# Altium schematic sheet Connector_Sheet.SchDoc
size A4; SheetNumber: 4; SheetTotal: 5
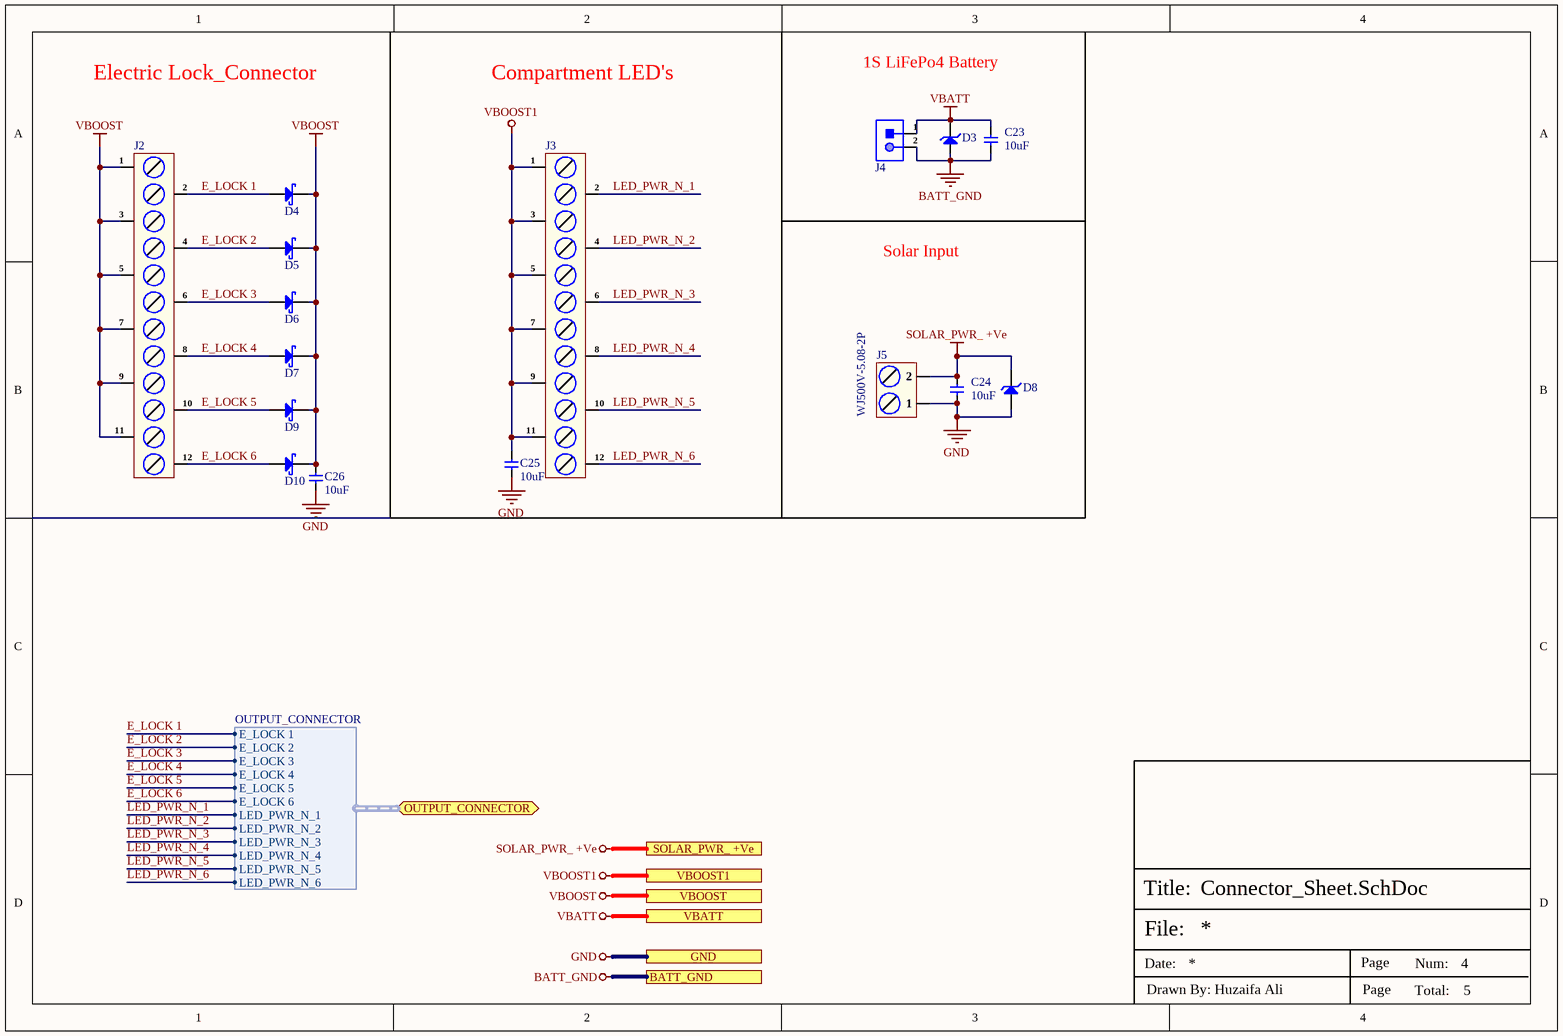
[diagram p0: Connector_Sheet.SchDoc]

## Parts
C23  10uF  [Cap-0603]
C24  10uF  [Cap-0603]
C25  10uF  [Cap-0603]
C26  10uF  [Cap-0603]
D3  SMBJ5.0A  [SMB_]  (value not drawn)
D4  1N5819HW-7-F  [SOD-123]  (value not drawn)
D5  1N5819HW-7-F  [SOD-123]  (value not drawn)
D6  1N5819HW-7-F  [SOD-123]  (value not drawn)
D7  1N5819HW-7-F  [SOD-123]  (value not drawn)
D8  AZ4024-01G  [SOD-123]  (value not drawn)
D9  1N5819HW-7-F  [SOD-123]  (value not drawn)
D10  1N5819HW-7-F  [SOD-123]  (value not drawn)
J2  MX128-5.0-12P-GN01-Cu-Y-A  [MX128-5.0-12P-GN01-Cu-Y-A]  (value not drawn)
J3  MX128-5.0-12P-GN01-Cu-Y-A  [MX128-5.0-12P-GN01-Cu-Y-A]  (value not drawn)
J4  S2B-PH-SM4-TB(LF)(SN)  [S2B-PH-SM4-TB(LF)(SN)]  (value not drawn)
J5  WJ500V-5.08-2P  [WJ500V-5.08-2P]

## Ports
BATT_GND, GND, OUTPUT_CONNECTOR (bidir, harness OUTPUT_CONNECTOR), SOLAR_PWR_ +Ve, VBATT, VBOOST, VBOOST1

## Harnesses
OUTPUT_CONNECTOR: E_LOCK 1, E_LOCK 2, E_LOCK 3, E_LOCK 4, E_LOCK 5, E_LOCK 6, LED_PWR_N_1, LED_PWR_N_2, LED_PWR_N_3, LED_PWR_N_4, LED_PWR_N_5, LED_PWR_N_6

## Nets
BATT_GND: C23.2 D3.1(A) J4.2 ; port BATT_GND
GND: C24.2 C25.1 C26.1 D8.1(A) J5.1 ; port GND
SOLAR_PWR_ +Ve: C24.1 D8.2(K) J5.2 ; port SOLAR_PWR_ +Ve
VBATT: C23.1 D3.2(K) J4.1 ; port VBATT
VBOOST: C26.2 D4.2(K) D5.2(K) D6.2(K) D7.2(K) D9.2(K) D10.2(K) J2.1 J2.3 J2.5 J2.7 J2.9 J2.11 ; port VBOOST
VBOOST1: C25.2 J3.1 J3.3 J3.5 J3.7 J3.9 J3.11 ; port VBOOST1
E_LOCK 1: D4.1(A) J2.2 ; port OUTPUT_CONNECTOR.E_LOCK 1
E_LOCK 2: D5.1(A) J2.4 ; port OUTPUT_CONNECTOR.E_LOCK 2
E_LOCK 3: D6.1(A) J2.6 ; port OUTPUT_CONNECTOR.E_LOCK 3
E_LOCK 4: D7.1(A) J2.8 ; port OUTPUT_CONNECTOR.E_LOCK 4
E_LOCK 5: D9.1(A) J2.10 ; port OUTPUT_CONNECTOR.E_LOCK 5
E_LOCK 6: D10.1(A) J2.12 ; port OUTPUT_CONNECTOR.E_LOCK 6
LED_PWR_N_1: J3.2 ; port OUTPUT_CONNECTOR.LED_PWR_N_1
LED_PWR_N_2: J3.4 ; port OUTPUT_CONNECTOR.LED_PWR_N_2
LED_PWR_N_3: J3.6 ; port OUTPUT_CONNECTOR.LED_PWR_N_3
LED_PWR_N_4: J3.8 ; port OUTPUT_CONNECTOR.LED_PWR_N_4
LED_PWR_N_5: J3.10 ; port OUTPUT_CONNECTOR.LED_PWR_N_5
LED_PWR_N_6: J3.12 ; port OUTPUT_CONNECTOR.LED_PWR_N_6

## Notes on the sheet
- Electric Lock_Connector
- Compartment LED's
- 1S LiFePo4 Battery
- Solar Input
- File:
- Title:
- Date:
- Page
- Num:
- Total:
- Drawn By: Huzaifa Ali

## Library data of the parts
C23-C26 = GRM188R6YA106MA73D: 10uF 35V X5R 20% Pad SMD 0603; Manufacturer: Murata; Supplier 1: Arrow Electronics; Manufacturer Part Number: GRM188R6YA106MA73D; RoHS: Yes; Category: Ceramic Capacitors; Stock 1: 37601; Pricing 1: 1=0.36650, 10=0.23380, 25=0.23160, 100=0.15050, 250=0.14890, 500=0.10700, 1000=0.09270, 3000=0.08640, 6000=0.07720, 15000=0.07140, 30000=0.05840 (USD); Mount: Surface Mount; Case/Package: 0603; Case Code (Metric): 1608; Case Code (Imperial): 0603; Min Operating Temperature: -55°C; Max Operating Temperature: 85°C; Packaging: Tape and Reel; Capacitance: 10uF; Voltage Rating: 35V; Tolerance: 20%; Voltage Rating (DC): 35V; Dielectric: X5R; Length: 0.063inch; Width: 0.031inch; Thickness: 0.039inch; RoHS Compliant: Yes; ComponentLink1URL: http://search.murata.co.jp/Ceramy/image/img/A01X/G101/ENG/GRM188R6YA106MA73-01.pdf?src-supplier=Future+Electronics; ComponentLink1Description: http://search.murata.co.jp/Ceramy/image/img/A01X/G101/ENG/GRM188R6YA106MA73-01.pdf?src-supplier=Future+Electronics; ComponentLink2URL: http://search.murata.co.jp/Ceramy/image/img/A01X/G101/ENG/GRM188R6YA106MA73-01.pdf?src-supplier=Digi-Key; ComponentLink2Description: http://search.murata.co.jp/Ceramy/image/img/A01X/G101/ENG/GRM188R6YA106MA73-01.pdf?src-supplier=Digi-Key; ComponentLink3URL: https://www.murata.com/~/media/webrenewal/support/library/catalog/products/capacitor/mlcc/c02e.ashx?la=en-us&src-supplier=Digi-Key; ComponentLink3Description: https://www.murata.com/~/media/webrenewal/support/library/catalog/products/capacitor/mlcc/c02e.ashx?la=en-us&src-supplier=Digi-Key; ComponentLink4URL: http://search.murata.co.jp/Ceramy/image/img/A01X/G101/ENG/GRM188R6YA106MA73-01.pdf?src-supplier=Mouser; ComponentLink4Description: http://search.murata.co.jp/Ceramy/image/img/A01X/G101/ENG/GRM188R6YA106MA73-01.pdf?src-supplier=Mouser; ComponentLink5URL: http://search.murata.co.jp/Ceramy/image/img/A01X/G101/ENG/GRM188R6YA106MA73-01.pdf?src-supplier=TTI; ComponentLink5Description: http://search.murata.co.jp/Ceramy/image/img/A01X/G101/ENG/GRM188R6YA106MA73-01.pdf?src-supplier=TTI; Supplier Part Number 1: GRM188R6YA106MA73D; LCSC Part Number: C194427
D3 = SMBJ5.0A: 65.2A 9.2V 6.4V 5V Unidirectional SMB TVS ROHS; Manufacturer: AnBon; Item Type: Diode; LCSC Part Number: C440263; Manufacturer Part Number: SMBJ5.0A; Package: SMB; ComponentLink7Description: LCSC; ComponentLink7URL: https://www.lcsc.com/product-detail/TVS_AnBon-SMBJ5-0A_C440263.html
D4-D7 D9 D10 = 1N5819HW-7-F: DIODE SCHOTTKY 40V 1A SOD123; Manufacturer: Diodes; Forward Voltage: 450mV; Max Reverse Current: 50uA; Element Configuration: Single; Max Forward Surge Current (Ifsm): 25A; Max Power Dissipation: 450mW; Polarity: Standard; Capacitance: 110pF; Supplier 1: Digi-Key; Manufacturer Part Number: 1N5819HW-7-F; RoHS: Yes; Category: Schottky Diodes; Pricing 1: 1=0.46000, 10=0.34500, 100=0.19530, 500=0.12936, 1000=0.09918 (USD); Case/Package: SOD-123-2; Number of Pins: 2; Weight: 0.000353oz; Contact Plating: Tin,Matte; Min Operating Temperature: -65°C; Max Operating Temperature: 125°C; Forward Current: 1A; Max Repetitive Reverse Voltage (Vrrm): 40V; Packaging: Tape and Reel; Peak Non-Repetitive Surge Current: 25A; Package Quantity: 3000; Average Rectified Current: 1A; Termination: SMD/SMT; Voltage Rating (DC): 40V; Current Rating: 1A; Output Current: 1A; Max Reverse Voltage (DC): 40V; Series: -; Length: 2.85mm; Width: 1.7mm; Height: 1.25mm; Radiation Hardening: No; RoHS Compliant: Yes; REACH SVHC: No SVHC; Lead Free: Lead Free; ComponentLink1URL: https://datasheet.ciiva.com/16303/ds30217-16303296.pdf?src-supplier=Future+Electronics; ComponentLink1Description: https://datasheet.ciiva.com/16303/ds30217-16303296.pdf?src-supplier=Future+Electronics; ComponentLink2URL: https://datasheet.ciiva.com/27092/1538419-27092484.pdf?src-supplier=Jameco; ComponentLink2Description: https://datasheet.ciiva.com/27092/1538419-27092484.pdf?src-supplier=Jameco; ComponentLink3URL: https://datasheet.ciiva.com/912/ds30217-912801.pdf?src-supplier=Digi-Key; ComponentLink3Description: https://datasheet.ciiva.com/912/ds30217-912801.pdf?src-supplier=Digi-Key; ComponentLink4URL: https://datasheet.ciiva.com/1177/ds30217-1177089.pdf?src-supplier=Element14; ComponentLink4Description: https://datasheet.ciiva.com/1177/ds30217-1177089.pdf?src-supplier=Element14; ComponentLink5URL: https://datasheet.ciiva.com/912/ds30217-912802.pdf?src-supplier=Digi-Key; ComponentLink5Description: https://datasheet.ciiva.com/912/ds30217-912802.pdf?src-supplier=Digi-Key; ComponentLink6URL: https://datasheet.ciiva.com/912/ds30217-912803.pdf?src-supplier=Digi-Key; ComponentLink6Description: https://datasheet.ciiva.com/912/ds30217-912803.pdf?src-supplier=Digi-Key; ComponentLink7URL: https://datasheet.ciiva.com/8303/ds30217-8303132.pdf?src-supplier=Avnet; ComponentLink7Description: https://datasheet.ciiva.com/8303/ds30217-8303132.pdf?src-supplier=Avnet; ComponentLink8URL: https://datasheet.ciiva.com/25919/ds30217-25919644.pdf?src-supplier=Avnet+Europe; ComponentLink8Description: https://datasheet.ciiva.com/25919/ds30217-25919644.pdf?src-supplier=Avnet+Europe; Supplier Part Number 1: 1N5819HW-FDICT-ND; LCSC Part Number: C82544; Item Type: Diode
D8 = AZ4024-01G: 26.7V 24V SOD-123 ESD and Surge Protection (TVS/ESD) ROHS; Manufacturer: AMAZING; Manufacturer Part Number: AZ4024-01G; Package: SOD-123; LCSC Part Number: C5571859; Item Type: (TVS/ESD); ComponentLink1Description: LCSC; ComponentLink1URL: https://www.lcsc.com/product-detail/ESD-and-Surge-Protection-TVS-ESD_AMAZING-AZ4024-01G_C5571859.html
J2 J3 = MX128-5.0-12P-GN01-Cu-Y-A: 1x12P 10A -40℃~+105℃ 300V Green 12~24 Direct Insert 5mm 1 12 Plugin,P=5mm Screw Terminal Blocks ROHS; Manufacturer: MAX; Manufacturer Part Number: MX128-5.0-12P-GN01-Cu-Y-A; Package: Plugin,P=5mm; LCSC Part Number: C5290376; Item Type: Terminal Block; ComponentLink1Description: LCSC; ComponentLink1URL: https://www.lcsc.com/product-detail/Screw-Terminal-Blocks_MAX-MX128-5-0-12P-GN01-Cu-Y-A_C5290376.html
J4 = S2B-PH-SM4-TB(LF)(SN): CONN HEADER SMD R/A 2POS 2MM; Manufacturer: JST; Item Type: Connectors; Voltage Rating: 100V; Current Rating: 3A; Insulation Resistance: 1GR; Number of Positions: 2; Gender: 29Gender; Number of Contacts: 2NUMBER; Max Current Rating: 2A; Contact Resistance: 20mR; Supplier: Future Electronics; LCSC Part Number: C295747; Manufacturer Part Number: S2B-PH-SM4-TB(LF)(SN); RoHS: No; Stock: 5000; Pricing: 1000=0.27, 2000=0.265, 3000=0.265, 4000=0.26, 5000=0.25 (USD); Mounting Technology: Surface Mount; Pins: 2NUMBER; Contact Material: Copper Alloy; Color: 46,47Colour; Contact Plating: 154ConductorMaterial; Housing Color: 50Colour; Housing Material: 4302ConductorMaterial; Weight: 28.349523g; Contact Shape: Square; Contact Finish - Mating: TIN; Insulation Material: Nylon; Insulation Color: Natural; Min Operating Temperature: -25°C; Max Operating Temperature: 85°C; Number of Rows: 1; Termination: Solder; Series: PH; Packaging: Cut Tape; Orientation: 5496OrientationType; Max Voltage Rating (AC): 100V; Voltage Rating (AC): 100V; Working Voltage: 100V; Connector Type: Header; Fastening Type: Detent; Contact Type: Male Pin; Voltage Rating (DC): 100V; Number of Poles: 2NUMBER; Length: 11.9mm; Width: 2.34mm; Height: 6mm; Pitch: 2mm; Depth: 7.6mm; Lead Pitch: 2mm; Contact Mating Length: 3.302mm; Flammability Rating: UL94 V-0; Reach SVHC Compliant: 4186SVHC; Lead Free: 5697LeadFree; ComponentLink1URL: http://www.farnell.com/datasheets/1699381.pdf?src-supplier=Farnell; ComponentLink1Description: http://www.farnell.com/datasheets/1699381.pdf?src-supplier=Farnell; ComponentLink2URL: http://datasheet.octopart.com/S2B-PH-SM4-TB-%28LF%29%28SN%29-JST-datasheet-12510261.pdf?src-supplier=Distrelec; ComponentLink2Description: http://datasheet.octopart.com/S2B-PH-SM4-TB-%28LF%29%28SN%29-JST-datasheet-12510261.pdf?src-supplier=Distrelec; ComponentLink3URL: http://www.farnell.com/datasheets/1699381.pdf?src-supplier=Newark; ComponentLink3Description: http://www.farnell.com/datasheets/1699381.pdf?src-supplier=Newark; ComponentLink4URL: https://datasheet.octopart.com/S2B-PH-SM4-TB%28LF%29%28SN%29-JST-datasheet-56537.pdf?src-supplier=Future+Electronics; ComponentLink4Description: https://datasheet.octopart.com/S2B-PH-SM4-TB%28LF%29%28SN%29-JST-datasheet-56537.pdf?src-supplier=Future+Electronics; ComponentLink5URL: http://www.farnell.com/datasheets/1699381.pdf?src-supplier=Element14; ComponentLink5Description: http://www.farnell.com/datasheets/1699381.pdf?src-supplier=Element14; ComponentLink6URL: https://datasheet.octopart.com/S2B-PH-SM4-TB-%28LF%29%28SN%29-JST-datasheet-12510261.pdf?src-supplier=TME; ComponentLink6Description: https://datasheet.octopart.com/S2B-PH-SM4-TB-%28LF%29%28SN%29-JST-datasheet-12510261.pdf?src-supplier=TME
J5 = WJ500V-5.08-2P: 1x2P 5.08mm 2.5 1 2 18A -40℃~+105℃ 250V Green 14~30 Direct Insert Plugin,P=5.08mm Screw Terminal Blocks ROHS; Manufacturer: Kangnex; Item Type: Terminal Block; LCSC Part Number: C8465; Manufacturer Part Number: WJ500V-5.08-2P; RoHS: No